# Altium schematic sheet stm32f411.SchDoc
size A3; SheetNumber: 8; SheetTotal: 15
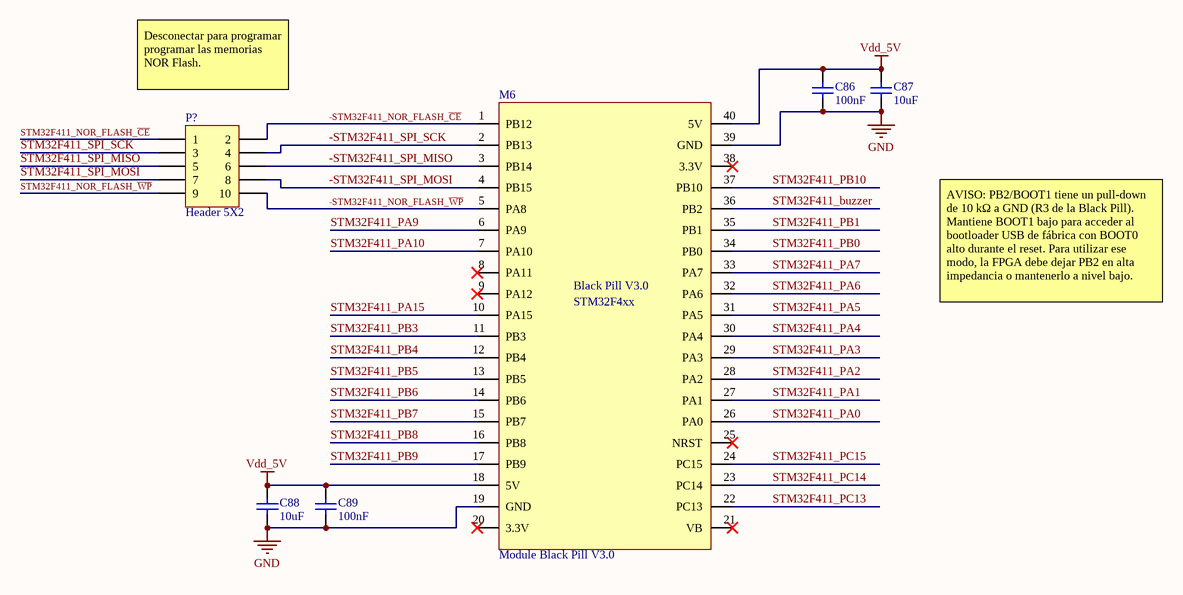
[diagram p0: stm32f411.SchDoc]

## Parts
C86  value 100nF  [capacitor 0603]  (hidden comment: Ceramic capacitor)
C87  value 10uF  [capacitor 0603]  (hidden comment: ceramic capacitor)
C88  value 10uF  [capacitor 0603]  (hidden comment: ceramic capacitor)
C89  value 100nF  [capacitor 0603]  (hidden comment: Ceramic capacitor)
M6  Module Black Pill V3.0  [module black pill v3.0]
P?  Header 5X2  [HDR2X5]

## Nets
GND: C86.1 C87.1 C88.1 C89.1 M6.19(GND) M6.39(GND)
Vdd_5V: C86.2 C87.2 C88.2 C89.2 M6.18(5V) M6.40(5V)
-STM32F411_NOR_FLASH_~{CE}: M6.1(PB12) P?.2
-STM32F411_NOR_FLASH_~{WP}: M6.5(PA8) P?.10
-STM32F411_SPI_MISO: M6.3(PB14) P?.6
-STM32F411_SPI_MOSI: M6.4(PB15) P?.8
-STM32F411_SPI_SCK: M6.2(PB13) P?.4
STM32F411_buzzer: M6.36(PB2)
STM32F411_NOR_FLASH_~{CE}: P?.1
STM32F411_NOR_FLASH_~{WP}: P?.9
STM32F411_PA0: M6.26(PA0)
STM32F411_PA1: M6.27(PA1)
STM32F411_PA2: M6.28(PA2)
STM32F411_PA3: M6.29(PA3)
STM32F411_PA4: M6.30(PA4)
STM32F411_PA5: M6.31(PA5)
STM32F411_PA6: M6.32(PA6)
STM32F411_PA7: M6.33(PA7)
STM32F411_PA9: M6.6(PA9)
STM32F411_PA10: M6.7(PA10)
STM32F411_PA15: M6.10(PA15)
STM32F411_PB0: M6.34(PB0)
STM32F411_PB1: M6.35(PB1)
STM32F411_PB3: M6.11(PB3)
STM32F411_PB4: M6.12(PB4)
STM32F411_PB5: M6.13(PB5)
STM32F411_PB6: M6.14(PB6)
STM32F411_PB7: M6.15(PB7)
STM32F411_PB8: M6.16(PB8)
STM32F411_PB9: M6.17(PB9)
STM32F411_PB10: M6.37(PB10)
STM32F411_PC13: M6.22(PC13)
STM32F411_PC14: M6.23(PC14)
STM32F411_PC15: M6.24(PC15)
STM32F411_SPI_MISO: P?.5
STM32F411_SPI_MOSI: P?.7
STM32F411_SPI_SCK: P?.3

Not connected (* = marked no-connect by the designer): M6 8(PA11)* 9(PA12)* 20(3.3V)* 21(VB)* 25(NRST)* 38(3.3V)*

## Notes on the sheet
- (near P?) Desconectar para programar programar las memorias NOR Flash.
- AVISO: PB2/BOOT1 tiene un pull-down de 10 kΩ a GND (R3 de la Black Pill). Mantiene BOOT1 bajo para acceder al bootloader USB de fábrica con BOOT0 alto durante el reset. Para utilizar ese modo, la FPGA debe dejar PB2 en alta impedancia o mantenerlo a nivel bajo.
- (in symbol Module Black Pill V3.0) Black Pill V3.0; STM32F4xx

## Library data of the parts
C86 C89 = Ceramic capacitor: Multilayer ceramic capacitor; V: 50; LCSC part: C14663; Package: 0603
C87 C88 = ceramic capacitor: Multilayer ceramic capacitor; V: 6.3; LCSC part: C1691; Package: 0603
M6 = Module Black Pill V3.0: Module Black Pill V3.0 / STM32F4xx
P? = Header 5X2: Header, 5-Pin, Dual row; LatestRevisionDate: 17-Jul-2002; LatestRevisionNote: Re-released for DXP Platform.; Publisher: Altium Limited